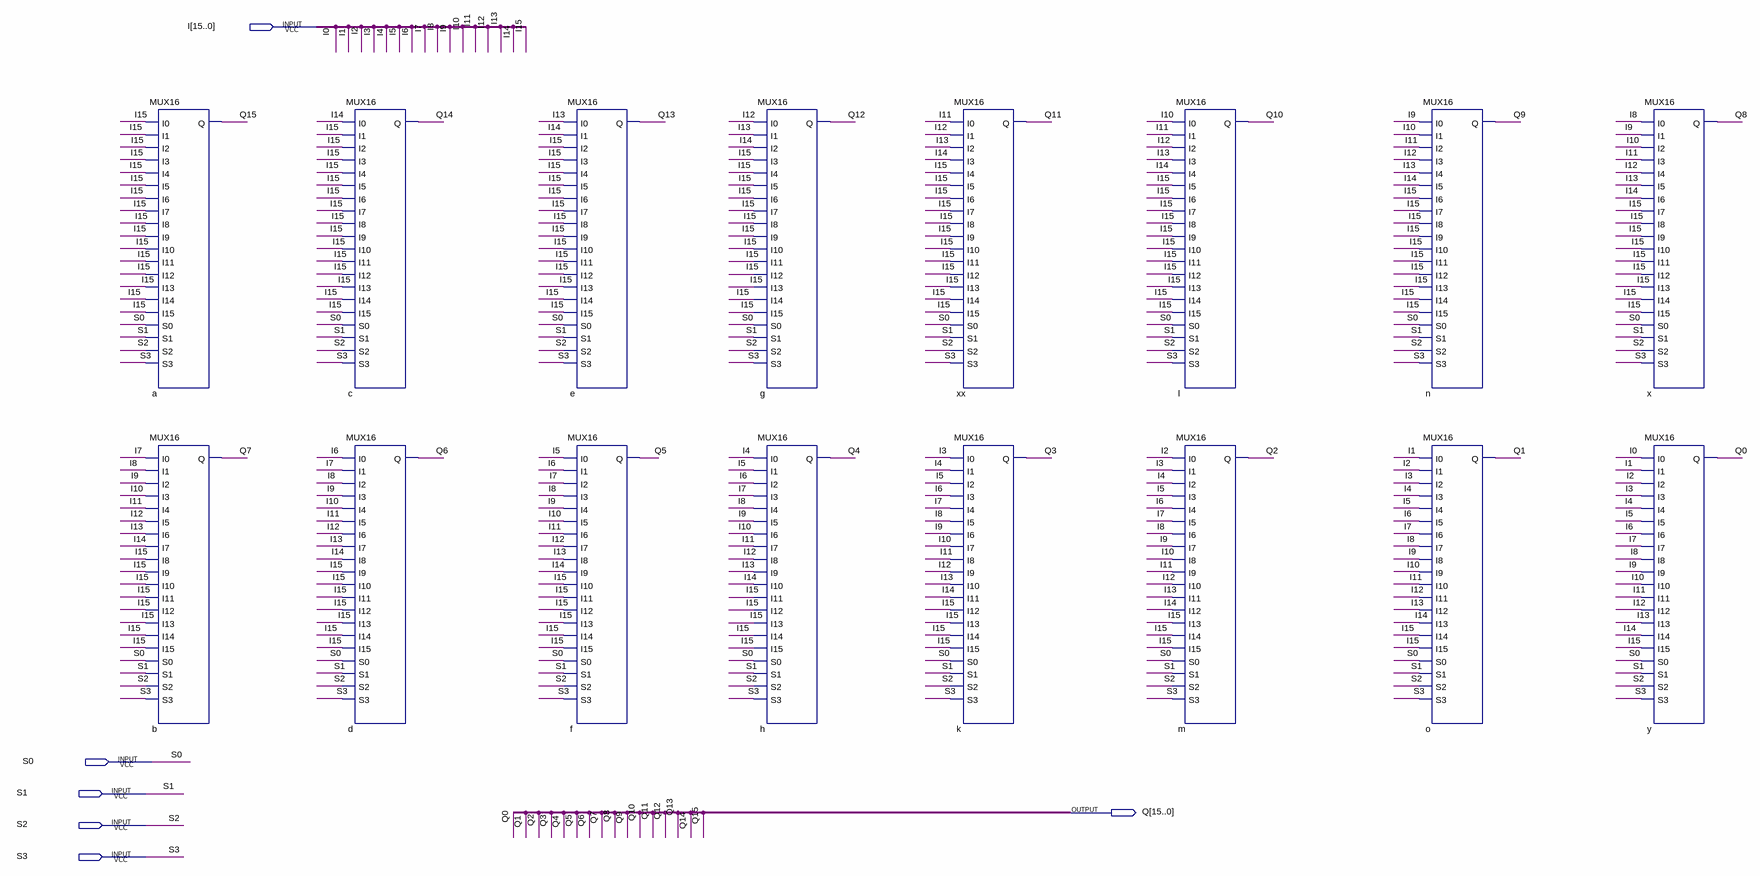
[diagram p0: schematic sheet]
// Quartus schematic RBS16.bdf as structural Verilog: 16 symbols, 6 pins
module RBS16 (
  input  [15:0] I,
  input  S0,
  input  S1,
  input  S2,
  input  S3,
  output [15:0] Q
);

  MUX16 a (
    .I0(I[15]), .I1(I[15]), .I2(I[15]), .I3(I[15]), .I4(I[15]), .I5(I[15]), .I6(I[15]), .I7(I[15]),
    .I8(I[15]), .I9(I[15]), .I10(I[15]), .I11(I[15]), .I12(I[15]), .I13(I[15]), .I14(I[15]), .I15(I[15]),
    .S0(S0), .S1(S1), .S2(S2), .S3(S3), .Q(Q[15]));
  MUX16 b (
    .I0(I[7]), .I1(I[8]), .I2(I[9]), .I3(I[10]), .I4(I[11]), .I5(I[12]), .I6(I[13]), .I7(I[14]), .I8(I[15]),
    .I9(I[15]), .I10(I[15]), .I11(I[15]), .I12(I[15]), .I13(I[15]), .I14(I[15]), .I15(I[15]), .S0(S0),
    .S1(S1), .S2(S2), .S3(S3), .Q(Q[7]));
  MUX16 c (
    .I0(I[14]), .I1(I[15]), .I2(I[15]), .I3(I[15]), .I4(I[15]), .I5(I[15]), .I6(I[15]), .I7(I[15]),
    .I8(I[15]), .I9(I[15]), .I10(I[15]), .I11(I[15]), .I12(I[15]), .I13(I[15]), .I14(I[15]), .I15(I[15]),
    .S0(S0), .S1(S1), .S2(S2), .S3(S3), .Q(Q[14]));
  MUX16 d (
    .I0(I[6]), .I1(I[7]), .I2(I[8]), .I3(I[9]), .I4(I[10]), .I5(I[11]), .I6(I[12]), .I7(I[13]), .I8(I[14]),
    .I9(I[15]), .I10(I[15]), .I11(I[15]), .I12(I[15]), .I13(I[15]), .I14(I[15]), .I15(I[15]), .S0(S0),
    .S1(S1), .S2(S2), .S3(S3), .Q(Q[6]));
  MUX16 e (
    .I0(I[13]), .I1(I[14]), .I2(I[15]), .I3(I[15]), .I4(I[15]), .I5(I[15]), .I6(I[15]), .I7(I[15]),
    .I8(I[15]), .I9(I[15]), .I10(I[15]), .I11(I[15]), .I12(I[15]), .I13(I[15]), .I14(I[15]), .I15(I[15]),
    .S0(S0), .S1(S1), .S2(S2), .S3(S3), .Q(Q[13]));
  MUX16 f (
    .I0(I[5]), .I1(I[6]), .I2(I[7]), .I3(I[8]), .I4(I[9]), .I5(I[10]), .I6(I[11]), .I7(I[12]), .I8(I[13]),
    .I9(I[14]), .I10(I[15]), .I11(I[15]), .I12(I[15]), .I13(I[15]), .I14(I[15]), .I15(I[15]), .S0(S0),
    .S1(S1), .S2(S2), .S3(S3), .Q(Q[5]));
  MUX16 g (
    .I0(I[12]), .I1(I[13]), .I2(I[14]), .I3(I[15]), .I4(I[15]), .I5(I[15]), .I6(I[15]), .I7(I[15]),
    .I8(I[15]), .I9(I[15]), .I10(I[15]), .I11(I[15]), .I12(I[15]), .I13(I[15]), .I14(I[15]), .I15(I[15]),
    .S0(S0), .S1(S1), .S2(S2), .S3(S3), .Q(Q[12]));
  MUX16 h (
    .I0(I[4]), .I1(I[5]), .I2(I[6]), .I3(I[7]), .I4(I[8]), .I5(I[9]), .I6(I[10]), .I7(I[11]), .I8(I[12]),
    .I9(I[13]), .I10(I[14]), .I11(I[15]), .I12(I[15]), .I13(I[15]), .I14(I[15]), .I15(I[15]), .S0(S0),
    .S1(S1), .S2(S2), .S3(S3), .Q(Q[4]));
  MUX16 xx (
    .I0(I[11]), .I1(I[12]), .I2(I[13]), .I3(I[14]), .I4(I[15]), .I5(I[15]), .I6(I[15]), .I7(I[15]),
    .I8(I[15]), .I9(I[15]), .I10(I[15]), .I11(I[15]), .I12(I[15]), .I13(I[15]), .I14(I[15]), .I15(I[15]),
    .S0(S0), .S1(S1), .S2(S2), .S3(S3), .Q(Q[11]));
  MUX16 k (
    .I0(I[3]), .I1(I[4]), .I2(I[5]), .I3(I[6]), .I4(I[7]), .I5(I[8]), .I6(I[9]), .I7(I[10]), .I8(I[11]),
    .I9(I[12]), .I10(I[13]), .I11(I[14]), .I12(I[15]), .I13(I[15]), .I14(I[15]), .I15(I[15]), .S0(S0),
    .S1(S1), .S2(S2), .S3(S3), .Q(Q[3]));
  MUX16 l (
    .I0(I[10]), .I1(I[11]), .I2(I[12]), .I3(I[13]), .I4(I[14]), .I5(I[15]), .I6(I[15]), .I7(I[15]),
    .I8(I[15]), .I9(I[15]), .I10(I[15]), .I11(I[15]), .I12(I[15]), .I13(I[15]), .I14(I[15]), .I15(I[15]),
    .S0(S0), .S1(S1), .S2(S2), .S3(S3), .Q(Q[10]));
  MUX16 m (
    .I0(I[2]), .I1(I[3]), .I2(I[4]), .I3(I[5]), .I4(I[6]), .I5(I[7]), .I6(I[8]), .I7(I[9]), .I8(I[10]),
    .I9(I[11]), .I10(I[12]), .I11(I[13]), .I12(I[14]), .I13(I[15]), .I14(I[15]), .I15(I[15]), .S0(S0),
    .S1(S1), .S2(S2), .S3(S3), .Q(Q[2]));
  MUX16 n (
    .I0(I[9]), .I1(I[10]), .I2(I[11]), .I3(I[12]), .I4(I[13]), .I5(I[14]), .I6(I[15]), .I7(I[15]),
    .I8(I[15]), .I9(I[15]), .I10(I[15]), .I11(I[15]), .I12(I[15]), .I13(I[15]), .I14(I[15]), .I15(I[15]),
    .S0(S0), .S1(S1), .S2(S2), .S3(S3), .Q(Q[9]));
  MUX16 o (
    .I0(I[1]), .I1(I[2]), .I2(I[3]), .I3(I[4]), .I4(I[5]), .I5(I[6]), .I6(I[7]), .I7(I[8]), .I8(I[9]),
    .I9(I[10]), .I10(I[11]), .I11(I[12]), .I12(I[13]), .I13(I[14]), .I14(I[15]), .I15(I[15]), .S0(S0),
    .S1(S1), .S2(S2), .S3(S3), .Q(Q[1]));
  MUX16 x (
    .I0(I[8]), .I1(I[9]), .I2(I[10]), .I3(I[11]), .I4(I[12]), .I5(I[13]), .I6(I[14]), .I7(I[15]), .I8(I[15]),
    .I9(I[15]), .I10(I[15]), .I11(I[15]), .I12(I[15]), .I13(I[15]), .I14(I[15]), .I15(I[15]), .S0(S0),
    .S1(S1), .S2(S2), .S3(S3), .Q(Q[8]));
  MUX16 y (
    .I0(I[0]), .I1(I[1]), .I2(I[2]), .I3(I[3]), .I4(I[4]), .I5(I[5]), .I6(I[6]), .I7(I[7]), .I8(I[8]),
    .I9(I[9]), .I10(I[10]), .I11(I[11]), .I12(I[12]), .I13(I[13]), .I14(I[14]), .I15(I[15]), .S0(S0),
    .S1(S1), .S2(S2), .S3(S3), .Q(Q[0]));
endmodule
